# EAGLE schematic Block Diagram - Final v2 (EAGLE 7.5.0)
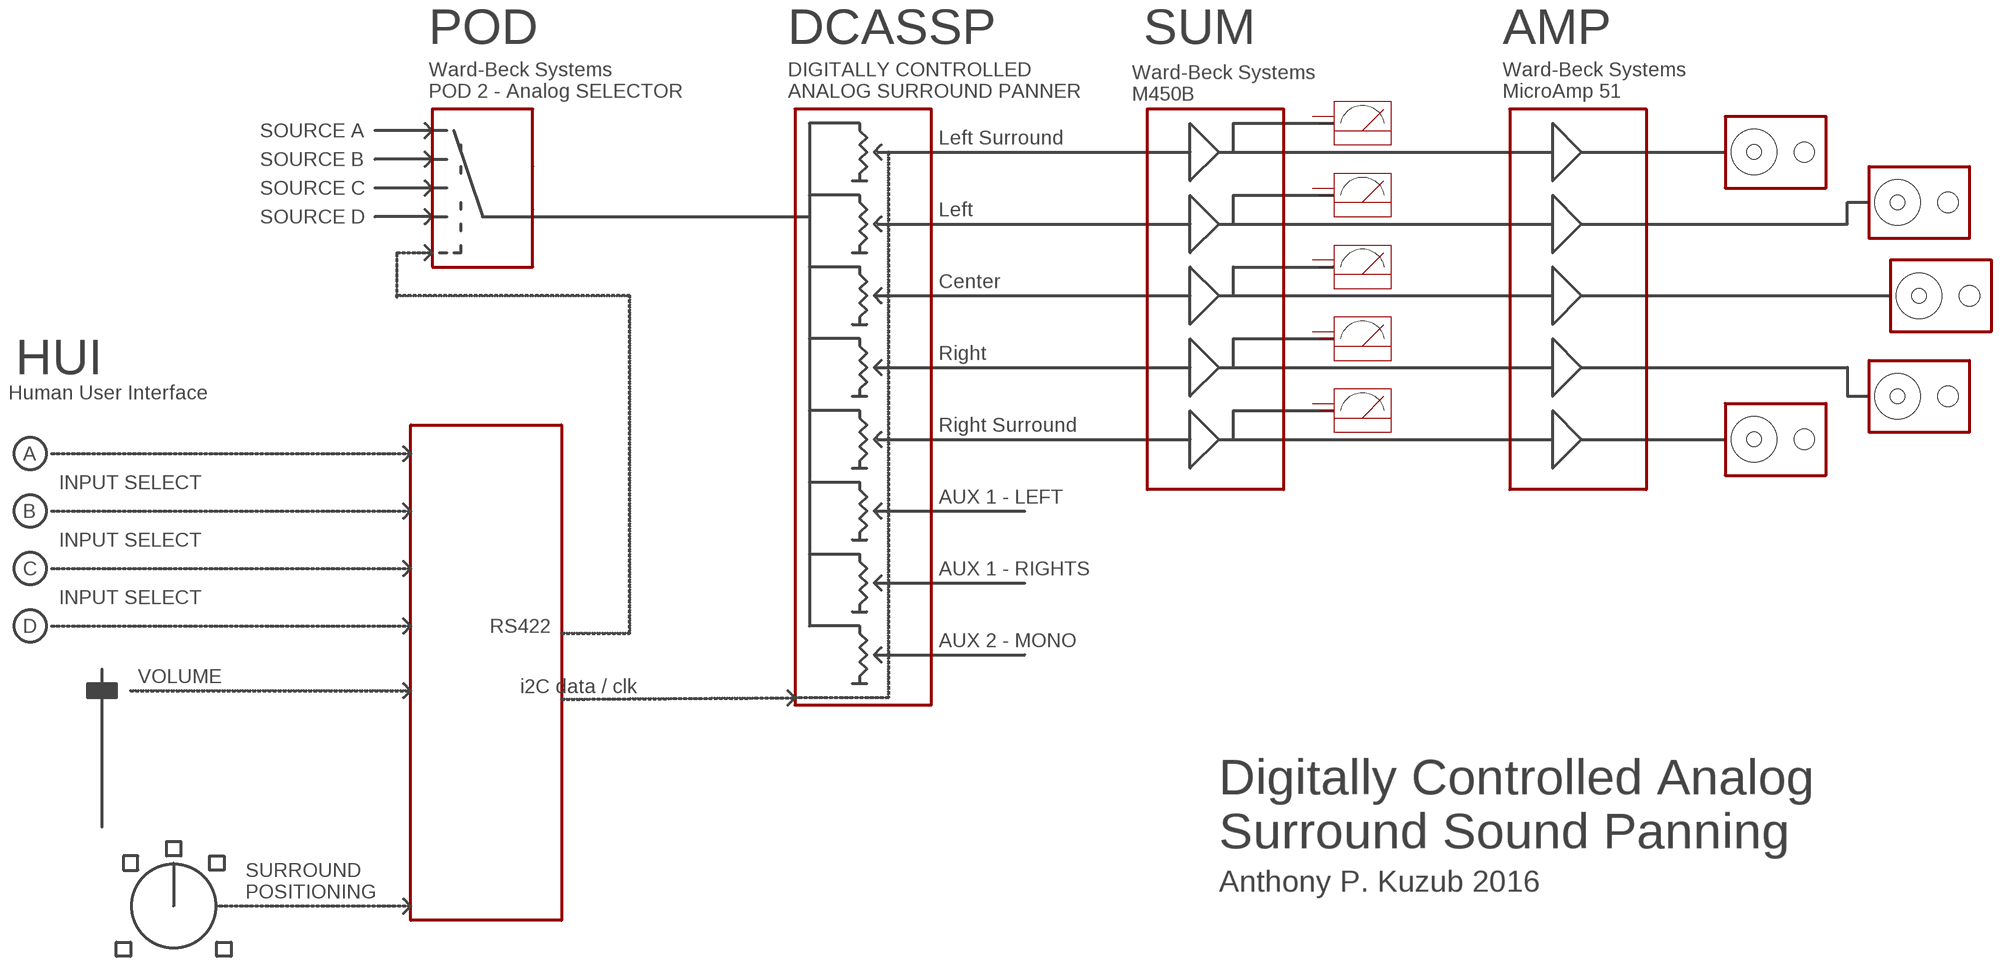
[diagram p0: schematic, sheet 1]

## Parts
U$1  VU_METER  [VU_METER]
U$2  VU_METER  [VU_METER]
U$3  VU_METER  [VU_METER]
U$4  VU_METER  [VU_METER]
U$5  VU_METER  [VU_METER]
U$6  VU_METER  [VU_METER]

## Nets
N$1: U$3.P$1 U$4.P$1
N$2: U$3.P$2 U$4.P$2
Unconnected: U$1.P$1 U$1.P$2 U$2.P$1 U$2.P$2 U$5.P$1 U$5.P$2 U$6.P$1 U$6.P$2

## Notes on the sheet
- POD | DCASSP | SUM | AMP
- Ward-Beck Systems
  POD 2 - Analog SELECTOR
- DIGITALLY CONTROLLED 
  ANALOG SURROUND PANNER
- Ward-Beck Systems
  MicroAmp 51
- Ward-Beck Systems
  M450B
- SOURCE A
- Left Surround
- SOURCE B
- SOURCE C
- Left
- SOURCE D
- Center
- Right
- HUI
- Human User Interface
- Right Surround
- A
- INPUT SELECT
- AUX 1 - LEFT
- B
- INPUT SELECT
- C | AUX 1 - RIGHTS
- INPUT SELECT
- D | RS422
- AUX 2 - MONO
- VOLUME
- i2C data / clk
- Digitally Controlled Analog
  Surround Sound Panning
- Anthony P. Kuzub 2016
- SURROUND 
  POSITIONING

## Library data of the parts
U$1-U$6 = TONY_WBS:VU_METER